# Altium schematic sheet [03] - MICROCONTROLLER.SchDoc
size A4; DocumentNumber: 3; SheetNumber: 3; SheetTotal: 6
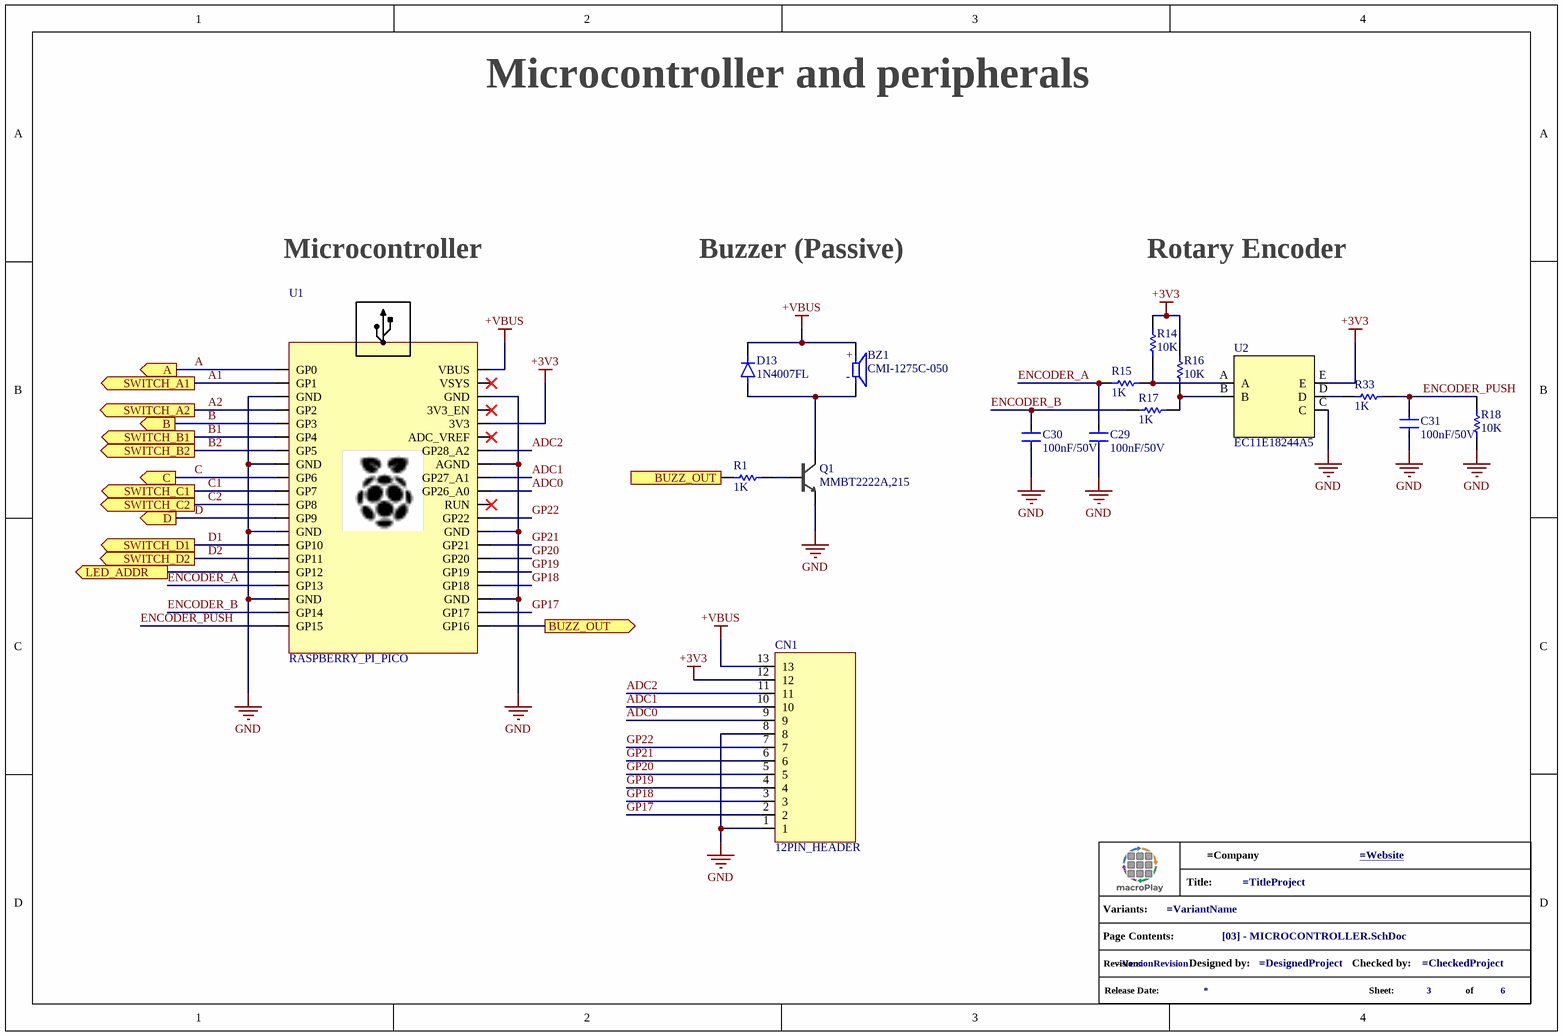
[diagram p0: [03] - MICROCONTROLLER.SchDoc]

## Parts
*?  info_project  (value not drawn)  (graphical)
BZ1  CMI-1275C-050  [CUI_CMI-1275C-050]
C29  100nF/50V  [C0805 - ironsoldering]
C30  100nF/50V  [C0805 - ironsoldering]
C31  100nF/50V  [C0805 - ironsoldering]
CN1  12PIN_HEADER  [12PINHEADER]
D13  1N4007FL  [SODFL3618X110N]
Q1  MMBT2222A,215  [SOT-23-3]
R1  1K  [R0805 - ironsoldering]
R14  10K  [R0805 - ironsoldering]
R15  1K  [R0805 - ironsoldering]
R16  10K  [R0805 - ironsoldering]
R17  1K  [R0805 - ironsoldering]
R18  10K  [R0805 - ironsoldering]
R33  1K  [R0805 - ironsoldering]
U1  RASPBERRY_PI_PICO  [RASPBERRY_PI_PICO]
U2  EC11E18244A5  [EC11E18244A5_ALPS]

## Ports
A (out), B (out), BUZZ_OUT (in), BUZZ_OUT (out), C (out), D (out), LED_ADDR (out), SWITCH_A1 (out), SWITCH_A2 (out), SWITCH_B1 (out), SWITCH_B2 (out), SWITCH_C1 (out), SWITCH_C2 (out), SWITCH_D1 (out), SWITCH_D2 (out)

## Nets
+3V3: CN1.12 R14.2 R16.2 U1.3V3 U2.E
+VBUS: BZ1.P CN1.13 D13.1(K) U1.VBUS
GND: C29.1 C30.1 C31.1 CN1.1 CN1.8 Q1.2(E) R18.1 U1.AGND U1.GND U2.C
A: U1.GP0 ; port A
A1: U1.GP1 ; port SWITCH_A1
A2: U1.GP2 ; port SWITCH_A2
ADC0: CN1.9 U1.GP26_A0
ADC1: CN1.10 U1.GP27_A1
ADC2: CN1.11 U1.GP28_A2
B: U1.GP3 ; port B
B1: U1.GP4 ; port SWITCH_B1
B2: U1.GP5 ; port SWITCH_B2
BUZZ_OUT: R1.1 U1.GP16 ; port BUZZ_OUT
C: U1.GP6 ; port C
C1: U1.GP7 ; port SWITCH_C1
C2: U1.GP8 ; port SWITCH_C2
D: U1.GP9 ; port D
D1: U1.GP10 ; port SWITCH_D1
D2: U1.GP11 ; port SWITCH_D2
ENCODER_A: C29.2 R15.1 U1.GP13
ENCODER_B: C30.2 R17.1 U1.GP14
ENCODER_PUSH: C31.2 R18.2 R33.2 U1.GP15
GP17: CN1.2 U1.GP17
GP18: CN1.3 U1.GP18
GP19: CN1.4 U1.GP19
GP20: CN1.5 U1.GP20
GP21: CN1.6 U1.GP21
GP22: CN1.7 U1.GP22
LED_ADDR: U1.GP12 ; port LED_ADDR
NetBZ1_N: BZ1.N D13.2(A) Q1.3(C)
NetQ1_1: Q1.1(B) R1.2
NetR14_1: R14.1 R15.2 U2.A
NetR16_1: R16.1 R17.2 U2.B
NetR33_1: R33.1 U2.D

Not connected (* = marked no-connect by the designer): U1 3V3_EN* ADC_VREF* RUN* VSYS*

## Notes on the sheet
- Microcontroller and peripherals
- Microcontroller
- Buzzer (Passive)
- Rotary Encoder
- (in symbol CMI-1275C-050) +; -
- (in symbol info_project) Title:; Variants:; Page Contents:; Revision:; Designed by:; Checked by:; Release Date:; Sheet:; of

## Library data of the parts
*? = info_project: GRAPHICAL - Info Project
BZ1 = CMI-1275C-050: 12 mm, 5 Vdc, 90 dB, 3.1 kHz, Through Hole, Magnetic Audio Indicator Buzzer; MF: Same Sky; SnapEDA_Link: https://www.snapeda.com/parts/CMI-1275C-050/Same+Sky/view-part/?ref=snap; Package: None; Value: *; MP: CMI-1275C-050; Check_prices: https://www.snapeda.com/parts/CMI-1275C-050/Same+Sky/view-part/?ref=eda
C29-C31 = CL21B104KBCNNNC: MLCC - 100nF 50V X7R 0805 ±10%; Manufacturer: Samsung Electro-Mechanics; Dielectric Material: Ceramic; .Mounting: SMD; Supplier: Future Electronics; Supplier Part Number: CL21B104KBCNNNC; Manufacturer Part Number: CL21B104KBCNNNC; RoHS: Compliant; Category: Ceramic Capacitors; Stock: 6136000; Pricing: 4000=0,0059, 16000=0,0057, 60000=0,0055, 100000=0,0054, 200000=0,0052 (USD); Value: 100nF; Case/Package: 0805; Case Code (Imperial): 0805; Case Code (Metric): 2012; China RoHS: Compliant; Contact Plating: Tin; Country of Origin: Mainland China, Philippines, South Korea; Depth: 1.25mm; Dielectric: X7R; Export Control Classification Number (ECCN) Code: EAR99; Height: 950µm; Harmonized Tariff Schedule (HTS) Code: 8532.24.00.20; Introduction Date: 2009-07-27; Lead Free: Lead Free; Length: 2mm; Lifecycle Status: Production; Material: Ceramic; Max Operating Temperature: 125°C; Min Operating Temperature: -55°C; Mounting Technology: Surface Mount; Number of Terminals: 2; Radiation Hardening: No; REACH SVHC: Yes; Schedule B: 8532240020, 8532240020|8532240020, 8532240020|8532240020|8532240020, 8532240020|8532240020|8532240020|8532240020; Thickness: 939.8µm; Tolerance: 10%; Voltage: 50V; Voltage Rating: 50V; Voltage Rating (DC): 50V; Width: 1.25mm; ComponentLink1URL: https://datasheet.octopart.com:443/CL21B104KBCNNNC-Samsung-Electro-Mechanics-datasheet-137745078.pdf?src-supplier=IHS; ComponentLink1Description: https://datasheet.octopart.com:443/CL21B104KBCNNNC-Samsung-Electro-Mechanics-datasheet-137745078.pdf?src-supplier=IHS; ComponentLink2URL: https://datasheet.octopart.com/CL21B104KBCNNNC-Samsung-Electro-Mechanics-datasheet-8324245.pdf; ComponentLink2Description: https://datasheet.octopart.com/CL21B104KBCNNNC-Samsung-Electro-Mechanics-datasheet-8324245.pdf; ComponentLink3URL: https://datasheet.octopart.com/CL21B104KBCNNNC-Samsung-Electro-Mechanics-datasheet-97040617.pdf; ComponentLink3Description: https://datasheet.octopart.com/CL21B104KBCNNNC-Samsung-Electro-Mechanics-datasheet-97040617.pdf; ComponentLink4URL: https://datasheet.octopart.com/General-Multilayer-Ceramic-Capacitors-Samsung-datasheet-family-111.pdf; ComponentLink4Description: https://datasheet.octopart.com/General-Multilayer-Ceramic-Capacitors-Samsung-datasheet-family-111.pdf; ComponentLink5URL: https://datasheet.octopart.com:443/CL21B104KBCNNNC-Samsung-Electro-Mechanics-datasheet-11548950.pdf?src-supplier=Future+Electronics; ComponentLink5Description: https://datasheet.octopart.com:443/CL21B104KBCNNNC-Samsung-Electro-Mechanics-datasheet-11548950.pdf?src-supplier=Future+Electronics; ComponentLink6URL: https://datasheet.octopart.com:443/CL21B104KBCNNNC-Samsung-Electro-Mechanics-datasheet-116891032.pdf?src-supplier=Future+Electronics; ComponentLink6Description: https://datasheet.octopart.com:443/CL21B104KBCNNNC-Samsung-Electro-Mechanics-datasheet-116891032.pdf?src-supplier=Future+Electronics; ComponentLink7URL: https://datasheet.octopart.com:443/CL21B104KBCNNNC-Samsung-Electro-Mechanics-datasheet-81462175.pdf?src-supplier=Future+Electronics; ComponentLink7Description: https://datasheet.octopart.com:443/CL21B104KBCNNNC-Samsung-Electro-Mechanics-datasheet-81462175.pdf?src-supplier=Future+Electronics; ComponentLink8URL: https://datasheet.octopart.com:443/CL21B104KBCNNNC-Samsung-datasheet-42485244.pdf?src-supplier=Future+Electronics; ComponentLink8Description: https://datasheet.octopart.com:443/CL21B104KBCNNNC-Samsung-datasheet-42485244.pdf?src-supplier=Future+Electronics; ComponentLink9URL: https://datasheet.octopart.com:443/CL21B104KBCNNNC-Samsung-Electro-Mechanics-datasheet-149045937.pdf?src-supplier=Future+Electronics; ComponentLink9Description: https://datasheet.octopart.com:443/CL21B104KBCNNNC-Samsung-Electro-Mechanics-datasheet-149045937.pdf?src-supplier=Future+Electronics; ComponentLink10URL: https://datasheet.octopart.com:443/CL21B104KBCNNNC-Samsung-datasheet-8326407.pdf?src-supplier=TME; ComponentLink10Description: https://datasheet.octopart.com:443/CL21B104KBCNNNC-Samsung-datasheet-8326407.pdf?src-supplier=TME; ComponentLink11URL: http://sigma.octopart.com:80/rohs_certificate/General-Multilayer-Ceramic-Capacitors-Samsung-family-110.pdf?src-supplier=Compliance+Statements; ComponentLink11Description: http://sigma.octopart.com:80/rohs_certificate/General-Multilayer-Ceramic-Capacitors-Samsung-family-110.pdf?src-supplier=Compliance+Statements; ComponentLink12URL: http://sigma.octopart.com:80/rohs_statement/General-Multilayer-Ceramic-Capacitors-Samsung-family-132.pdf?src-supplier=Compliance+Statements; ComponentLink12Description: http://sigma.octopart.com:80/rohs_statement/General-Multilayer-Ceramic-Capacitors-Samsung-family-132.pdf?src-supplier=Compliance+Statements; ComponentLink13URL: http://sigma.octopart.com:80/reach_statement/General-Multilayer-Ceramic-Capacitors-Samsung-family-133.pdf?src-supplier=Compliance+Statements; ComponentLink13Description: http://sigma.octopart.com:80/reach_statement/General-Multilayer-Ceramic-Capacitors-Samsung-family-133.pdf?src-supplier=Compliance+Statements; .SCHChecked: *; .PCBChecked: *
CN1 = 12PIN_HEADER: 12PIN HEADER CONNECTOR
D13 = 1N4007FL: Diode - Standard 1000 V 1A Surface Mount SOD-123FL; MF: SMC Diode Solutions; SnapEDA_Link: https://www.snapeda.com/parts/1N4007FL/SMC/view-part/?ref=snap; Package: None; Value: *; MP: 1N4007FL; Check_prices: https://www.snapeda.com/parts/1N4007FL/SMC/view-part/?ref=eda
Q1 = MMBT2222A,215: TRANS - Single Bipolar Transistor, NPN, 40 V, 600 mA, 250 mW, SOT-23 (TO-236AB), 3 Pins, Surface Mount; Manufacturer: Nexperia; Manufacturer Lifecycle Status: RELEASED FOR SUPPLY; Collector Base Voltage (VCBO): 75V; Collector Emitter Breakdown Voltage: 40V; Collector Emitter Saturation Voltage: 1V; Emitter Base Voltage (VEBO): 6V; Frequency: 300MHz; hFE Min: 40; Max Collector Current: 600mA; Max Junction Temperature (Tj): 150°C; Max Power Dissipation: 250mW; Number of Elements: 1; Supplier: Newark; Supplier Part Number: MMBT2222A,215; Manufacturer Part Number: MMBT2222A,215; RoHS: Compliant; Category: BJTs; Stock: 23090; Pricing: 1=0,269, 10=0,167, 25=0,145, 50=0,124 (USD); Ambient Temperature Range High: 150°C; Case/Package: SOT-23; China RoHS: Compliant; Collector Emitter Voltage (VCEO): 40V; Contact Plating: Tin; Country of Origin: Mainland China, Malaysia; Export Control Classification Number (ECCN) Code: EAR99; Element Configuration: Single; Gain Bandwidth Product: 300MHz; Height: 1.1mm; Introduction Date: 2003-04-28; Lead Free: Lead Free; Length: 3mm; Lifecycle Status: Production; Max Breakdown Voltage: 40V; Clock Frequency: 300MHz; Max Operating Temperature: 150°C; Min Operating Temperature: -65°C; Mounting Technology: Surface Mount; Pins: 3; Number of Terminals: 3; Polarity: NPN; Power Dissipation: 250mW; Radiation Hardening: No; Ratings: AEC-Q101; REACH SVHC: Yes; Schedule B: 8541210080, 8541210080|8541210080|8541210080|8541210080|8541210080; Termination: SMD/SMT; Transition Frequency: 300MHz; Weight: 4.535924g; Width: 1.4mm; ComponentLink1URL: https://sigma.octopart.com:443/138797052/technical_drawing/Nexperia-MMBT2222A%2C215.pdf?src-supplier=Upverter; ComponentLink1Description: https://sigma.octopart.com:443/138797052/technical_drawing/Nexperia-MMBT2222A%2C215.pdf?src-supplier=Upverter; ComponentLink2URL: https://datasheet.octopart.com:443/MMBT2222A%2C215-Nexperia-datasheet-87581373.pdf?src-supplier=LKR; ComponentLink2Description: https://datasheet.octopart.com:443/MMBT2222A%2C215-Nexperia-datasheet-87581373.pdf?src-supplier=LKR; ComponentLink3URL: https://datasheet.octopart.com:443/MMBT2222A%2C215-Nexperia-datasheet-8386369.pdf?src-supplier=element14+APAC; ComponentLink3Description: https://datasheet.octopart.com:443/MMBT2222A%2C215-Nexperia-datasheet-8386369.pdf?src-supplier=element14+APAC; ComponentLink4URL: https://datasheet.octopart.com:443/MMBT2222A%2C215-Nexperia-datasheet-8884867.pdf?src-supplier=element14+APAC; ComponentLink4Description: https://datasheet.octopart.com:443/MMBT2222A%2C215-Nexperia-datasheet-8884867.pdf?src-supplier=element14+APAC; ComponentLink5URL: https://datasheet.octopart.com:443/MMBT2222A%2C215-Nexperia-datasheet-180923983.pdf?src-supplier=IHS; ComponentLink5Description: https://datasheet.octopart.com:443/MMBT2222A%2C215-Nexperia-datasheet-180923983.pdf?src-supplier=IHS; ComponentLink6URL: https://datasheet.octopart.com:443/MMBT2222A%2C215-Philips-datasheet-14064901.pdf?src-supplier=iiiC; ComponentLink6Description: https://datasheet.octopart.com:443/MMBT2222A%2C215-Philips-datasheet-14064901.pdf?src-supplier=iiiC; ComponentLink7URL: http://sigma.octopart.com:80/reach_statement/NXP-Semiconductors-company-13.pdf?src-supplier=Compliance+Statements; ComponentLink7Description: http://sigma.octopart.com:80/reach_statement/NXP-Semiconductors-company-13.pdf?src-supplier=Compliance+Statements; ComponentLink8URL: http://sigma.octopart.com:80/rohs_statement/NXP-Semiconductors-company-12.pdf?src-supplier=Compliance+Statements; ComponentLink8Description: http://sigma.octopart.com:80/rohs_statement/NXP-Semiconductors-company-12.pdf?src-supplier=Compliance+Statements
R1 R15 R17 R33 = RR1220P-102-D: RES - 1K 0.1W 0805 ±0.5% Chip Resistor; Manufacturer: Susumu; Manufacturer Package Identifier: 0805 (2012 metric); Max Power Dissipation: 100mW; Value: 1kΩ; Temperature Coefficient: 25ppm/°C; Voltage Rating: 100V; .Mounting: SMD; Supplier: Future Electronics; Supplier Part Number: RR1220P-102-D; Manufacturer Part Number: RR1220P-102-D; RoHS: Compliant; Category: Chip SMD Resistors; Stock: 25000; Pricing: 5000=0,0159, 15000=0,0155, 25000=0,0153, 50000=0,0151, 100000=0,0147 (USD); Case/Package: 0805; Case Code (Imperial): 0805; Composition: Thin Film; Country of Origin: Mainland China, Japan; Depth: 1.25mm; Export Control Classification Number (ECCN) Code: EAR99; Height: 400µm; Harmonized Tariff Schedule (HTS) Code: 8533.21.00.30; Introduction Date: 2004-01-27; Lead Free: Lead Free; Length: 2mm; Lifecycle Status: NRND; Max Operating Temperature: 125°C; Min Operating Temperature: -55°C; Mounting Technology: Surface Mount; Pins: 2; Number of Terminals: 2; Number of Terminations: 2; Packaging: Cut Tape; Power Rating: 100mW; REACH SVHC: No; Termination: SMD/SMT; Tolerance: 0.5%; Voltage Rating (DC): 100V; Width: 1.25mm; Working Voltage: 100V; ComponentLink1URL: https://datasheet.octopart.com:443/RR1220P-102-D-Susumu-datasheet-159770900.pdf?src-supplier=Newark; ComponentLink1Description: https://datasheet.octopart.com:443/RR1220P-102-D-Susumu-datasheet-159770900.pdf?src-supplier=Newark; ComponentLink2URL: https://datasheet.octopart.com:443/RR1220P-102-D-Susumu-datasheet-5302462.pdf?src-supplier=Newark; ComponentLink2Description: https://datasheet.octopart.com:443/RR1220P-102-D-Susumu-datasheet-5302462.pdf?src-supplier=Newark; ComponentLink3URL: https://datasheet.octopart.com:443/RR1220P-102-D-Susumu-datasheet-722.pdf?src-supplier=Newark; ComponentLink3Description: https://datasheet.octopart.com:443/RR1220P-102-D-Susumu-datasheet-722.pdf?src-supplier=Newark; ComponentLink4URL: https://datasheet.octopart.com:443/RR1220P-102-D-Susumu-datasheet-78834971.pdf?src-supplier=Farnell; ComponentLink4Description: https://datasheet.octopart.com:443/RR1220P-102-D-Susumu-datasheet-78834971.pdf?src-supplier=Farnell; ComponentLink5URL: https://datasheet.octopart.com:443/RR1220P-102-D-Susumu-datasheet-10941792.pdf?src-supplier=element14+APAC; ComponentLink5Description: https://datasheet.octopart.com:443/RR1220P-102-D-Susumu-datasheet-10941792.pdf?src-supplier=element14+APAC; ComponentLink6URL: https://datasheet.octopart.com:443/RR1220P-102-D-Susumu-datasheet-62069792.pdf?src-supplier=Future+Electronics; ComponentLink6Description: https://datasheet.octopart.com:443/RR1220P-102-D-Susumu-datasheet-62069792.pdf?src-supplier=Future+Electronics; ComponentLink7URL: https://datasheet.octopart.com:443/RR1220P-102-D-Susumu-datasheet-11047391.pdf?src-supplier=Future+Electronics; ComponentLink7Description: https://datasheet.octopart.com:443/RR1220P-102-D-Susumu-datasheet-11047391.pdf?src-supplier=Future+Electronics; ComponentLink8URL: https://datasheet.octopart.com:443/RR1220P-102-D-Susumu-datasheet-118815.pdf?src-supplier=DigiKey; ComponentLink8Description: https://datasheet.octopart.com:443/RR1220P-102-D-Susumu-datasheet-118815.pdf?src-supplier=DigiKey; .PCBChecked: *; .SCHChecked: *
R14 R16 R18 = RMCF0805FT10K0: RES - 10K 1/16W 0805 ±1% Chip Resistor; Manufacturer: Stackpole Electronics; Manufacturer Package Identifier: 0805 (2012 metric); Max Power Dissipation: 125mW; Value: 10kΩ; Temperature Coefficient: 100ppm/°C; Voltage Rating: 150V; .Mounting: SMD; Supplier: Future Electronics; Supplier Part Number: RMCF0805FT10K0; Manufacturer Part Number: RMCF0805FT10K0; RoHS: Compliant; Category: Chip SMD Resistors; Stock: 3170000; Pricing: 10000=0,0027, 25000=0,0027, 100000=0,0026, 150000=0,0025, 375000=0,0024 (USD); Case/Package: 0805; Case Code (Imperial): 0805; Case Code (Metric): 2012; China RoHS: Non-Compliant; Composition: Thick Film; Contact Plating: Tin; Depth: 1.25mm; Features: Automotive AEC-Q200; Height: 500µm; Lead Free: Lead Free; Length: 2mm; Lifecycle Status: Production; Max Operating Temperature: 155°C; Military Standard: Not; Min Operating Temperature: -55°C; Mounting Technology: Surface Mount; Number of Terminals: 2; Number of Terminations: 2; Packaging: Cut Tape (CT); Power Rating: 125mW; Radiation Hardening: No; Ratings: AEC-Q200; REACH SVHC: Yes; Schedule B: 8533210045, 8533210045|8533210045, 8533210045|8533210045|8533210045, 8533210045|8533210045|8533210045|8533210045; Tolerance: 1%; Width: 1.25mm; Working Voltage: 150V; ComponentLink1URL: https://datasheet.octopart.com:443/RMCF0805FT10K0-Stackpole-Electronics-datasheet-182148065.pdf?src-supplier=IHS; ComponentLink1Description: https://datasheet.octopart.com:443/RMCF0805FT10K0-Stackpole-Electronics-datasheet-182148065.pdf?src-supplier=IHS; ComponentLink2URL: https://datasheet.octopart.com:443/RMCF0805FT10K0-Stackpole-Electronics-datasheet-12534581.pdf?src-supplier=Upverter; ComponentLink2Description: https://datasheet.octopart.com:443/RMCF0805FT10K0-Stackpole-Electronics-datasheet-12534581.pdf?src-supplier=Upverter; ComponentLink3URL: https://datasheet.octopart.com:443/RMCF0805FT10K0-Stackpole-Electronics-datasheet-12510902.pdf?src-supplier=Upverter; ComponentLink3Description: https://datasheet.octopart.com:443/RMCF0805FT10K0-Stackpole-Electronics-datasheet-12510902.pdf?src-supplier=Upverter; ComponentLink4URL: https://datasheet.octopart.com:443/RMCF0805FT10K0-Stackpole-Electronics-datasheet-28504820.pdf?src-supplier=Master+Electronics; ComponentLink4Description: https://datasheet.octopart.com:443/RMCF0805FT10K0-Stackpole-Electronics-datasheet-28504820.pdf?src-supplier=Master+Electronics; ComponentLink5URL: https://datasheet.octopart.com:443/RMCF0805FT10K0-Stackpole-Electronics-datasheet-141193804.pdf?src-supplier=Stackpole+Electronics; ComponentLink5Description: https://datasheet.octopart.com:443/RMCF0805FT10K0-Stackpole-Electronics-datasheet-141193804.pdf?src-supplier=Stackpole+Electronics; ComponentLink6URL: https://datasheet.octopart.com:443/RMCF0805FT10K0-Stackpole-Electronics-datasheet-62091608.pdf?src-supplier=Stackpole+Electronics; ComponentLink6Description: https://datasheet.octopart.com:443/RMCF0805FT10K0-Stackpole-Electronics-datasheet-62091608.pdf?src-supplier=Stackpole+Electronics; ComponentLink7URL: https://datasheet.octopart.com:443/RMCF0805FT10K0-Stackpole-Electronics-datasheet-10788263.pdf?src-supplier=Stackpole+Electronics; ComponentLink7Description: https://datasheet.octopart.com:443/RMCF0805FT10K0-Stackpole-Electronics-datasheet-10788263.pdf?src-supplier=Stackpole+Electronics; ComponentLink8URL: https://datasheet.octopart.com:443/RMCF0805FT10K0-Stackpole-Electronics-datasheet-154799224.pdf?src-supplier=JRH+Electronics; ComponentLink8Description: https://datasheet.octopart.com:443/RMCF0805FT10K0-Stackpole-Electronics-datasheet-154799224.pdf?src-supplier=JRH+Electronics; ComponentLink9URL: https://datasheet.octopart.com:443/RMCF0805FT10K0-Stackpole-Electronics-datasheet-11546843.pdf?src-supplier=Arrow+Electronics; ComponentLink9Description: https://datasheet.octopart.com:443/RMCF0805FT10K0-Stackpole-Electronics-datasheet-11546843.pdf?src-supplier=Arrow+Electronics; ComponentLink10URL: https://datasheet.octopart.com:443/RMCF0805FT10K0-Stackpole-Electronics-datasheet-11547379.pdf?src-supplier=Future+Electronics; ComponentLink10Description: https://datasheet.octopart.com:443/RMCF0805FT10K0-Stackpole-Electronics-datasheet-11547379.pdf?src-supplier=Future+Electronics; ComponentLink11URL: https://datasheet.octopart.com:443/RMCF0805FT10K0-Stackpole-Electronics-datasheet-8359789.pdf?src-supplier=Future+Electronics; ComponentLink11Description: https://datasheet.octopart.com:443/RMCF0805FT10K0-Stackpole-Electronics-datasheet-8359789.pdf?src-supplier=Future+Electronics; ComponentLink12URL: https://datasheet.octopart.com:443/RMCF0805FT10K0-Stackpole-Electronics-datasheet-8324226.pdf?src-supplier=Future+Electronics; ComponentLink12Description: https://datasheet.octopart.com:443/RMCF0805FT10K0-Stackpole-Electronics-datasheet-8324226.pdf?src-supplier=Future+Electronics; ComponentLink13URL: https://datasheet.octopart.com:443/RMCF0805FT10K0-Stackpole-Electronics-datasheet-8088878.pdf?src-supplier=Future+Electronics; ComponentLink13Description: https://datasheet.octopart.com:443/RMCF0805FT10K0-Stackpole-Electronics-datasheet-8088878.pdf?src-supplier=Future+Electronics; ComponentLink14URL: https://datasheet.octopart.com:443/RMCF0805FT10K0-Stackpole-Electronics-datasheet-5313682.pdf?src-supplier=Future+Electronics; ComponentLink14Description: https://datasheet.octopart.com:443/RMCF0805FT10K0-Stackpole-Electronics-datasheet-5313682.pdf?src-supplier=Future+Electronics; ComponentLink15URL: http://sigma.octopart.com:80/15940719/materials_sheet/Stackpole-Electronics-RMCF0805FT10K0.pdf?src-supplier=Compliance+Statements; ComponentLink15Description: http://sigma.octopart.com:80/15940719/materials_sheet/Stackpole-Electronics-RMCF0805FT10K0.pdf?src-supplier=Compliance+Statements; ComponentLink16URL: http://sigma.octopart.com:80/141158211/reach_statement/Stackpole-Electronics-RMCF0805FT10K0.pdf?src-supplier=Compliance+Statements; ComponentLink16Description: http://sigma.octopart.com:80/141158211/reach_statement/Stackpole-Electronics-RMCF0805FT10K0.pdf?src-supplier=Compliance+Statements; ComponentLink17URL: http://sigma.octopart.com:80/141158212/rohs_statement/Stackpole-Electronics-RMCF0805FT10K0.pdf?src-supplier=Compliance+Statements; ComponentLink17Description: http://sigma.octopart.com:80/141158212/rohs_statement/Stackpole-Electronics-RMCF0805FT10K0.pdf?src-supplier=Compliance+Statements; .SCHChecked: *; .PCBChecked: *
U1 = RASPBERRY_PI_PICO: MCU Module - Raspberry Pi Board, Arm Cortex-M0+; Core Architecture:Arm; Core Sub-Architecture:Cortex-M0+; Kit Contents:Raspberry Pi Pico Board; No. Of Bits:32Bit; Silicon Core Number:Rp2040; Silicon Manufacturer:Raspberry Pi |Raspberry-Pi RASPBERRY PI PICO; .Mounting: SMD or PTH variant; SnapEDA_Link: https://www.snapeda.com/parts/RASPBERRY%20PI%20PICO/Raspberry+Pi/view-part/?ref=snap; Package: None; Value: *; MF: Raspberry Pi; MP: RASPBERRY PI PICO; Check_prices: https://www.snapeda.com/parts/RASPBERRY%20PI%20PICO/Raspberry+Pi/view-part/?ref=eda; .PCBChecked: *; .SCHChecked: *
U2 = EC11E18244A5: ENCODER - Rotary Encoder Incremental 18 Quadrature (Incremental) Vertical; Manufacturer 1: Alps Electric; Copyright: Copyright (C) 2025 Ultra Librarian. All rights reserved.; Manufacturer Part Number 1: EC11E18244A5; RefDes: RefDes; Type: Type; .SCHChecked: *; .PCBChecked: *; .Mounting: *